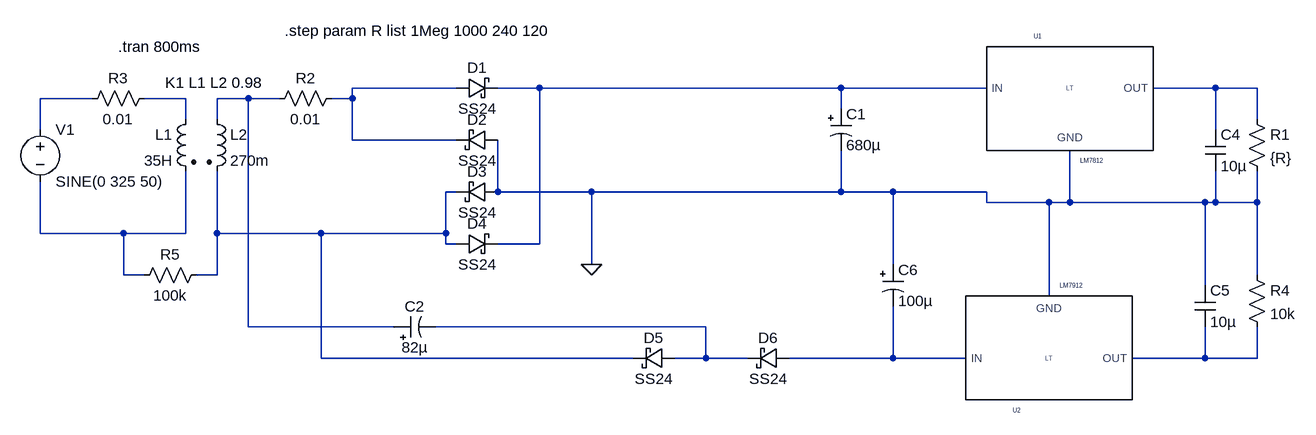
[diagram p0: schematic transformer.asc]
transformer.asc, the LTspice schematic file:
Version 4
SHEET 1 1904 680
WIRE 608 48 448 48
WIRE 736 48 672 48
WIRE 1200 48 736 48
WIRE 1424 48 1200 48
WIRE 1776 48 1680 48
WIRE 1840 48 1776 48
WIRE 48 64 -32 64
WIRE 192 64 128 64
WIRE 288 64 240 64
WIRE 336 64 288 64
WIRE 448 64 448 48
WIRE 448 64 416 64
WIRE 1200 80 1200 48
WIRE 192 96 192 64
WIRE 240 96 240 64
WIRE 1840 96 1840 48
WIRE -32 112 -32 64
WIRE 1776 112 1776 48
WIRE 448 128 448 64
WIRE 608 128 448 128
WIRE 608 208 592 208
WIRE 672 208 672 128
WIRE 816 208 672 208
WIRE 1200 208 1200 144
WIRE 1200 208 816 208
WIRE 1280 208 1200 208
WIRE 1424 208 1280 208
WIRE 1424 224 1424 208
WIRE 1520 224 1424 224
WIRE 1552 224 1552 144
WIRE 1552 224 1520 224
WIRE 1760 224 1552 224
WIRE 1776 224 1776 176
WIRE 1776 224 1760 224
WIRE 1840 224 1840 176
WIRE 1840 224 1776 224
WIRE -32 272 -32 192
WIRE 96 272 -32 272
WIRE 192 272 192 176
WIRE 192 272 96 272
WIRE 240 272 240 176
WIRE 400 272 240 272
WIRE 592 272 592 208
WIRE 592 272 400 272
WIRE 592 288 592 272
WIRE 608 288 592 288
WIRE 736 288 736 48
WIRE 736 288 672 288
WIRE 816 320 816 208
WIRE 1280 320 1280 208
WIRE 96 336 96 272
WIRE 128 336 96 336
WIRE 240 336 240 272
WIRE 240 336 208 336
WIRE 1840 336 1840 224
WIRE 1760 352 1760 224
WIRE 1520 368 1520 224
WIRE 288 416 288 64
WIRE 512 416 288 416
WIRE 992 416 576 416
WIRE 400 464 400 272
WIRE 880 464 400 464
WIRE 992 464 992 416
WIRE 992 464 944 464
WIRE 1056 464 992 464
WIRE 1280 464 1280 384
WIRE 1280 464 1120 464
WIRE 1392 464 1280 464
WIRE 1760 464 1760 416
WIRE 1760 464 1648 464
WIRE 1840 464 1840 416
WIRE 1840 464 1760 464
FLAG 816 320 0
SYMBOL ind2 224 80 R0
SYMATTR InstName L2
SYMATTR Value 270m
SYMATTR Type ind
SYMATTR SpiceLine Rser=22.7
SYMBOL ind2 208 80 M0
SYMATTR InstName L1
SYMATTR Value 35H
SYMATTR Type ind
SYMATTR SpiceLine Rser=3.5k
SYMBOL voltage -32 96 R0
WINDOW 123 0 0 Left 2
WINDOW 39 0 0 Left 2
SYMATTR InstName V1
SYMATTR Value SINE(0 325 50)
SYMBOL res 1824 80 R0
SYMATTR InstName R1
SYMATTR Value {R}
SYMBOL schottky 608 64 R270
WINDOW 0 32 32 VTop 2
WINDOW 3 0 32 VBottom 2
SYMATTR InstName D1
SYMATTR Value SS24
SYMATTR Description Diode
SYMATTR Type diode
SYMBOL schottky 672 112 R90
WINDOW 0 0 32 VBottom 2
WINDOW 3 32 32 VTop 2
SYMATTR InstName D2
SYMATTR Value SS24
SYMATTR Description Diode
SYMATTR Type diode
SYMBOL schottky 672 192 R90
WINDOW 0 0 32 VBottom 2
WINDOW 3 32 32 VTop 2
SYMATTR InstName D3
SYMATTR Value SS24
SYMATTR Description Diode
SYMATTR Type diode
SYMBOL schottky 608 304 R270
WINDOW 0 32 32 VTop 2
WINDOW 3 0 32 VBottom 2
SYMATTR InstName D4
SYMATTR Value SS24
SYMATTR Description Diode
SYMATTR Type diode
SYMBOL polcap 1184 80 R0
WINDOW 3 24 56 Left 2
SYMATTR Value 680µ
SYMATTR InstName C1
SYMATTR Description Capacitor
SYMATTR Type cap
SYMATTR SpiceLine V=50 Irms=1.47 Rser=0.053 Lser=0 mfg="Panasonic" pn="ECA1HFQ681" type="Al electrolytic"
SYMBOL res 432 48 R90
WINDOW 0 0 56 VBottom 2
WINDOW 3 32 56 VTop 2
SYMATTR InstName R2
SYMATTR Value 0.01
SYMBOL res 144 48 R90
WINDOW 0 0 56 VBottom 2
WINDOW 3 32 56 VTop 2
SYMATTR InstName R3
SYMATTR Value 0.01
SYMBOL Regulators\\7812 1552 48 R0
SYMATTR InstName U1
SYMBOL polcap 512 432 R270
WINDOW 0 32 32 VTop 2
WINDOW 3 0 32 VBottom 2
SYMATTR InstName C2
SYMATTR Value 82µ
SYMATTR Description Capacitor
SYMATTR Type cap
SYMATTR SpiceLine V=25 Irms=285m Rser=0.3 Lser=0 mfg="Nichicon" pn="UPL1E820MPH" type="Al electrolytic"
SYMBOL schottky 944 448 R90
WINDOW 0 0 32 VBottom 2
WINDOW 3 32 32 VTop 2
SYMATTR InstName D5
SYMATTR Value SS24
SYMATTR Description Diode
SYMATTR Type diode
SYMBOL schottky 1120 448 R90
WINDOW 0 0 32 VBottom 2
WINDOW 3 32 32 VTop 2
SYMATTR InstName D6
SYMATTR Value SS24
SYMATTR Description Diode
SYMATTR Type diode
SYMBOL Regulators\\7912 1520 464 M180
SYMATTR InstName U2
SYMBOL cap 1760 112 R0
SYMATTR InstName C4
SYMATTR Value 10µ
SYMBOL cap 1744 352 R0
SYMATTR InstName C5
SYMATTR Value 10µ
SYMBOL res 1824 320 R0
SYMATTR InstName R4
SYMATTR Value 10k
SYMBOL polcap 1264 320 R0
WINDOW 3 24 56 Left 2
SYMATTR InstName C6
SYMATTR Value 100µ
SYMATTR Description Capacitor
SYMATTR Type cap
SYMATTR SpiceLine V=25 Irms=145m Rser=0.62 Lser=0 mfg="Nichicon" pn="UPR1E101MPH" type="Al electrolytic"
SYMBOL res 224 320 R90
WINDOW 0 0 56 VBottom 2
WINDOW 3 32 56 VTop 2
SYMATTR InstName R5
SYMATTR Value 100k
TEXT 160 40 Left 2 !K1 L1 L2 0.98
TEXT 88 -16 Left 2 !.tran 800ms
TEXT 344 -40 Left 2 !.step param R list 1Meg 1000 240 120

The netlist it stands for:
* transformer.asc
L2 N006 N007 270m Rser=22.7
L1 N005 N008 35H Rser=3.5k
V1 N004 N008 SINE(0 325 50)
R1 N003 0 {R}
D1 N001 N002 SS24
D2 0 N001 SS24
D3 0 N007 SS24
D4 N007 N002 SS24
C1 N002 0 680µ V=50 Irms=1.47 Rser=0.053 Lser=0 mfg="Panasonic" pn="ECA1HFQ681" type="Al electrolytic"
R2 N001 N006 0.01
R3 N005 N004 0.01
XU1 N002 0 N003 LM7812  ; pins IN GND OUT
C2 N006 N009 82µ V=25 Irms=285m Rser=0.3 Lser=0 mfg="Nichicon" pn="UPL1E820MPH" type="Al electrolytic"
D5 N009 N007 SS24
D6 N010 N009 SS24
XU2 N010 0 N011 LM7912  ; pins IN GND OUT
C4 N003 0 10µ
C5 0 N011 10µ
R4 0 N011 10k
C6 0 N010 100µ V=25 Irms=145m Rser=0.62 Lser=0 mfg="Nichicon" pn="UPR1E101MPH" type="Al electrolytic"
R5 N007 N008 100k
.model D D
.lib standard.dio
K1 L1 L2 0.98
.tran 800ms
.step param R list 1Meg 1000 240 120
.lib regulators.lib
.lib regulators2.lib
.backanno
.end